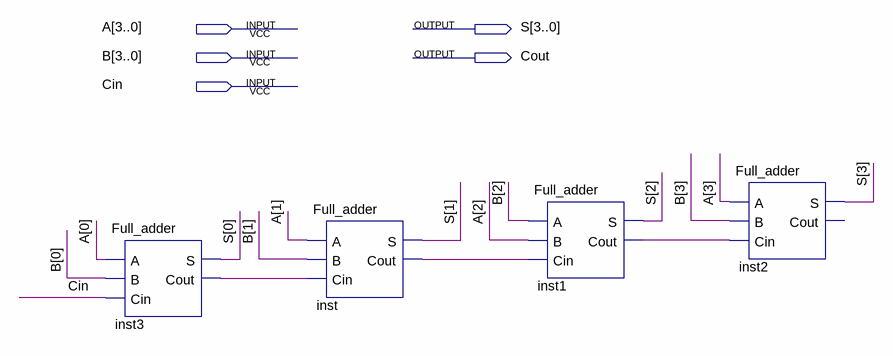
[diagram p0: schematic sheet]
// Quartus schematic RCA4.bdf as structural Verilog: 4 symbols, 5 pins
module RCA4 (
  input  [3:0] A,
  input  [3:0] B,
  input  Cin,
  output [3:0] S,
  output Cout
);

  wire inst1_cout, inst3_cout, inst_cout;

  Full_adder inst3 (.A(A[0]), .B(B[0]), .Cin(Cin), .S(S[0]), .Cout(inst3_cout));
  Full_adder inst (.A(A[1]), .B(B[1]), .Cin(inst3_cout), .S(S[1]), .Cout(inst_cout));
  Full_adder inst1 (.A(B[2]), .B(A[2]), .Cin(inst_cout), .S(S[2]), .Cout(inst1_cout));
  Full_adder inst2 (.A(A[3]), .B(B[3]), .Cin(inst1_cout), .S(S[3]));  // open: Cout
endmodule
